# Altium schematic sheet Button_Sheet_2.SchDoc
size A; SheetNumber: 12; SheetTotal: 12
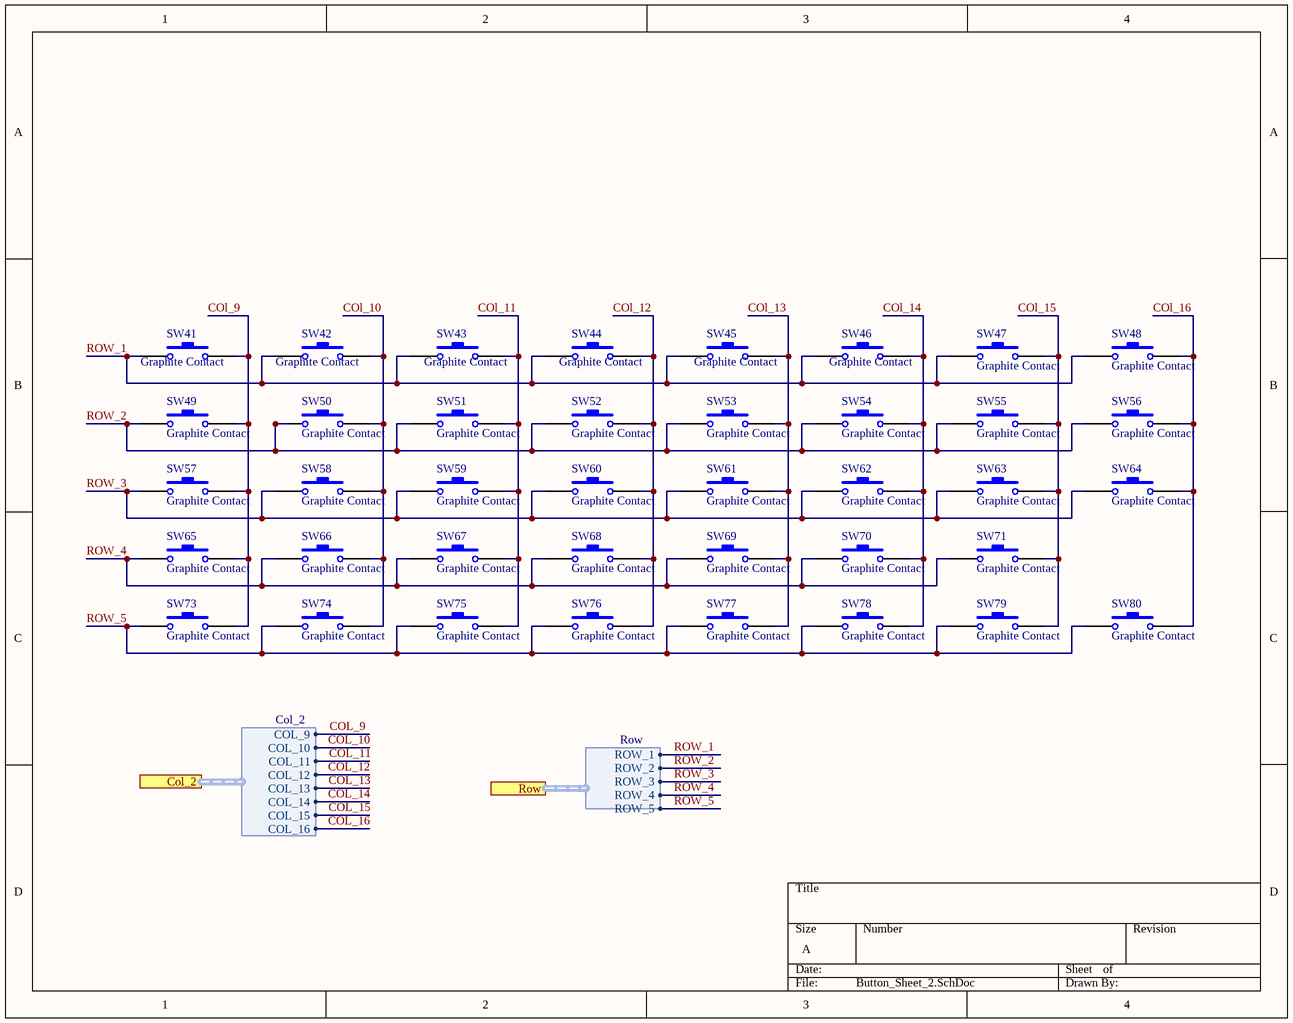
[diagram p0: Button_Sheet_2.SchDoc]

## Parts
SW41  Graphite Contact  [Graphite Contact]
SW42  Graphite Contact  [Graphite Contact]
SW43  Graphite Contact  [Graphite Contact]
SW44  Graphite Contact  [Graphite Contact]
SW45  Graphite Contact  [Graphite Contact]
SW46  Graphite Contact  [Graphite Contact]
SW47  Graphite Contact  [Graphite Contact]
SW48  Graphite Contact  [Graphite Contact]
SW49  Graphite Contact  [Graphite Contact]
SW50  Graphite Contact  [Graphite Contact]
SW51  Graphite Contact  [Graphite Contact]
SW52  Graphite Contact  [Graphite Contact]
SW53  Graphite Contact  [Graphite Contact]
SW54  Graphite Contact  [Graphite Contact]
SW55  Graphite Contact  [Graphite Contact]
SW56  Graphite Contact  [Graphite Contact]
SW57  Graphite Contact  [Graphite Contact]
SW58  Graphite Contact  [Graphite Contact]
SW59  Graphite Contact  [Graphite Contact]
SW60  Graphite Contact  [Graphite Contact]
SW61  Graphite Contact  [Graphite Contact]
SW62  Graphite Contact  [Graphite Contact]
SW63  Graphite Contact  [Graphite Contact]
SW64  Graphite Contact  [Graphite Contact]
SW65  Graphite Contact  [Graphite Contact]
SW66  Graphite Contact  [Graphite Contact]
SW67  Graphite Contact  [Graphite Contact]
SW68  Graphite Contact  [Graphite Contact]
SW69  Graphite Contact  [Graphite Contact]
SW70  Graphite Contact  [Graphite Contact]
SW71  Graphite Contact  [Graphite Contact]
SW73  Graphite Contact  [Graphite Contact]
SW74  Graphite Contact  [Graphite Contact]
SW75  Graphite Contact  [Graphite Contact]
SW76  Graphite Contact  [Graphite Contact]
SW77  Graphite Contact  [Graphite Contact]
SW78  Graphite Contact  [Graphite Contact]
SW79  Graphite Contact  [Graphite Contact]
SW80  Graphite Contact  [Graphite Contact]

## Ports
Col_2 (harness Col_2), Row (harness Row)

## Harnesses
Col_2: COL_16, COL_15, COL_14, COL_13, COL_12, COL_11, COL_10, COL_9
Row: ROW_5, ROW_4, ROW_3, ROW_2, ROW_1

## Nets
COl_9: SW41.2 SW49.2 SW57.2 SW65.2 SW73.2 ; port Col_2.COL_9
COl_10: SW42.2 SW50.2 SW58.2 SW66.2 SW74.2 ; port Col_2.COL_10
COl_11: SW43.2 SW51.2 SW59.2 SW67.2 SW75.2 ; port Col_2.COL_11
COl_12: SW44.2 SW52.2 SW60.2 SW68.2 SW76.2 ; port Col_2.COL_12
COl_13: SW45.2 SW53.2 SW61.2 SW69.2 SW77.2 ; port Col_2.COL_13
COl_14: SW46.2 SW54.2 SW62.2 SW70.2 SW78.2 ; port Col_2.COL_14
COl_15: SW47.2 SW55.2 SW63.2 SW71.2 SW79.2 ; port Col_2.COL_15
COl_16: SW48.2 SW56.2 SW64.2 SW80.2 ; port Col_2.COL_16
ROW_1: SW41.1 SW42.1 SW43.1 SW44.1 SW45.1 SW46.1 SW47.1 SW48.1 ; port Row.ROW_1
ROW_2: SW49.1 SW50.1 SW51.1 SW52.1 SW53.1 SW54.1 SW55.1 SW56.1 ; port Row.ROW_2
ROW_3: SW57.1 SW58.1 SW59.1 SW60.1 SW61.1 SW62.1 SW63.1 SW64.1 ; port Row.ROW_3
ROW_4: SW65.1 SW66.1 SW67.1 SW68.1 SW69.1 SW70.1 SW71.1 ; port Row.ROW_4
ROW_5: SW73.1 SW74.1 SW75.1 SW76.1 SW77.1 SW78.1 SW79.1 SW80.1 ; port Row.ROW_5

## Library data of the parts
SW41-SW71 SW73-SW80 = Graphite Contact: Push Button for Graphite Contact